# EAGLE schematic issue26039_wire_over_pin (EAGLE 9.6.2)
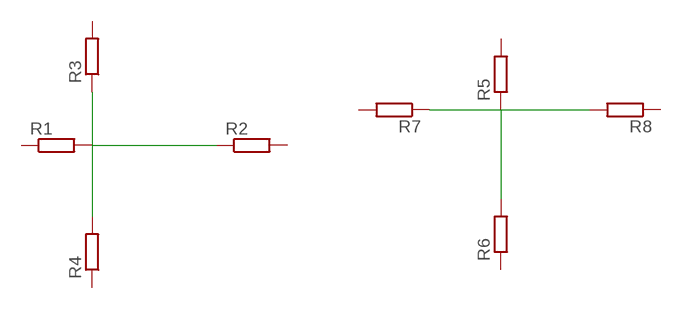
[diagram p0: schematic, sheet 1]

## Parts
R1  R-EU_0207/10  [0207/10]
R2  R-EU_0207/10  [0207/10]
R3  R-EU_0207/10  [0207/10]
R4  R-EU_0207/10  [0207/10]
R5  R-EU_0207/10  [0207/10]
R6  R-EU_0207/10  [0207/10]
R7  R-EU_0207/10  [0207/10]
R8  R-EU_0207/10  [0207/10]

## Nets
N$1: R1.2 R2.1
N$2: R3.1 R4.2
N$3: R5.1 R6.2
N$4: R7.1 R8.2
Unconnected: R1.1 R2.2 R3.2 R4.1 R5.2 R6.1 R7.2 R8.1

## Library data of the parts
R1-R8 = rcl:R-EU_: RESISTOR, European symbol